# EasyEDA Pro project SOP100E 2025.05.27.eprj, schematic Schematic3
Board Name: Board3; Create Date: 2026-01-22; Page Name: P1; Project Name: SOP100E 2025.05.27; Schematic Name: Schematic3; Update Date: 2026-01-22; Company: 嘉立创EDA; Page Size: A4; Version: V1.0
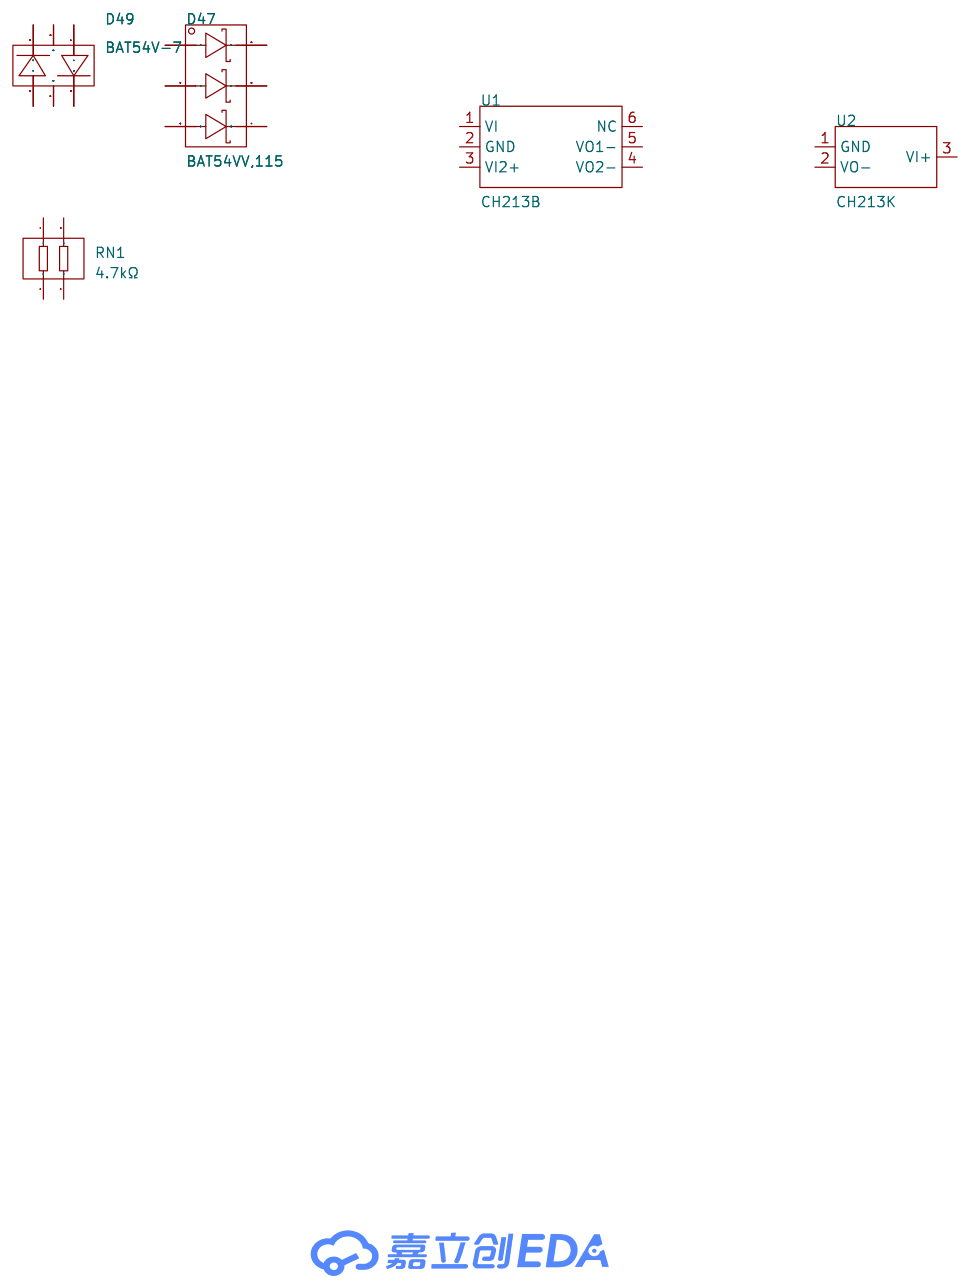
[diagram p14: schematic sheet]

## Parts
D47  BAT54VV,115  [SOT-666-6_L1.6-W1.2-P0.50-LS1.6-BR]
D49  BAT54V-7  [SOT-563_L1.6-W1.2-P0.50-LS1.6-BL]
RN1  4.7kΩ  [RES-ARRAY-SMD_0402-4P-L1.0-W1.0-BL]
U1  CH213B  [SOT-23-6_L2.9-W1.6-P0.95-LS2.8-BR]
U2  CH213K  [SOT-23-3_L2.9-W1.6-P1.90-LS2.8-BR]

## Library data of the parts
D47 = BAT54VV,115: LCSC Part Name: 电压:30V 电流:200mA; Supplier Part: C549281; Manufacturer: Nexperia(安世); Supplier Footprint: SOT-666-6; JLCPCB Part Class: 扩展库; Datasheet: https://item.szlcsc.com/datasheet/BAT54VV%252C115/570349.html; Supplier: LCSC; Diode Configuration: 3个独立式; Voltage - Forward(Vf@If): 800mV@100mA; Voltage - DC Reverse(Vr): 30V; Current - Rectified: 200mA; Reverse Leakage Current (Ir): 2uA@25V; Non-Repetitive Peak Forward Surge Current: 600mA
D49 = BAT54V-7: LCSC Part Name: 电压:30V 电流:200mA; Supplier Part: C134416; Manufacturer: DIODES(美台); Supplier Footprint: SOT-563; JLCPCB Part Class: 扩展库; Datasheet: https://item.szlcsc.com/datasheet/BAT54V-7/145726.html; Supplier: LCSC; Diode Configuration: 2个独立式; Voltage - Forward(Vf@If): 1V@100mA; Voltage - DC Reverse(Vr): 30V; Current - Rectified: 200mA; Reverse Leakage Current (Ir): 2uA@25V; Operating Junction Temperature Range: -65℃~+125℃; Non-Repetitive Peak Forward Surge Current: 600mA
RN1 = 2D02WGJ0472TCE: LCSC Part Name: 4.7kΩ ±5%; Supplier Part: C474299; Manufacturer: UNI-ROYAL(厚声); Supplier Footprint: 0402x2; JLCPCB Part Class: 扩展库; Datasheet: https://item.szlcsc.com/datasheet/2D02WGJ0472TCE/480832.html; Supplier: LCSC; Number of Resistors: 2; Tolerance: ±5%; Power(Watts): 62.5mW; Temperature Coefficient: ±200ppm/℃; Number of Pins: 4
U1 = CH213B: Supplier Part: C48393289; Supplier Footprint: SOT23-6; JLCPCB Part Class: 扩展库; Datasheet: https://atta.szlcsc.com/upload/public/pdf/source/20250604/4D9C01A98181B74F3A19FF00D4921A5B.pdf; Supplier: LCSC
U2 = CH213K: Supplier Part: C5456874; Manufacturer: WCH(南京沁恒); Supplier Footprint: SOT-23-3; JLCPCB Part Class: 扩展库; Datasheet: https://item.szlcsc.com/datasheet/CH213K/6369803.html; Supplier: LCSC

## Nets

Not connected (* = marked no-connect by the designer): D47 1(A1) 2(A2) 3(A3) 4(C3) 5(C2) 6(C1); D49 1(A) 2(NC) 3(C) 4(A) 5(NC) 6(C); RN1 1 2 3 4; U1 1(VI) 2(GND) 3(VI2+) 4(VO2-) 5(VO1-) 6(NC); U2 1(GND) 2(VO-) 3(VI+)
